# EAGLE board Claritone_Main (EAGLE 9.7.0), part 1 of 2
PCB_MANUFACTURER: JLCPCB
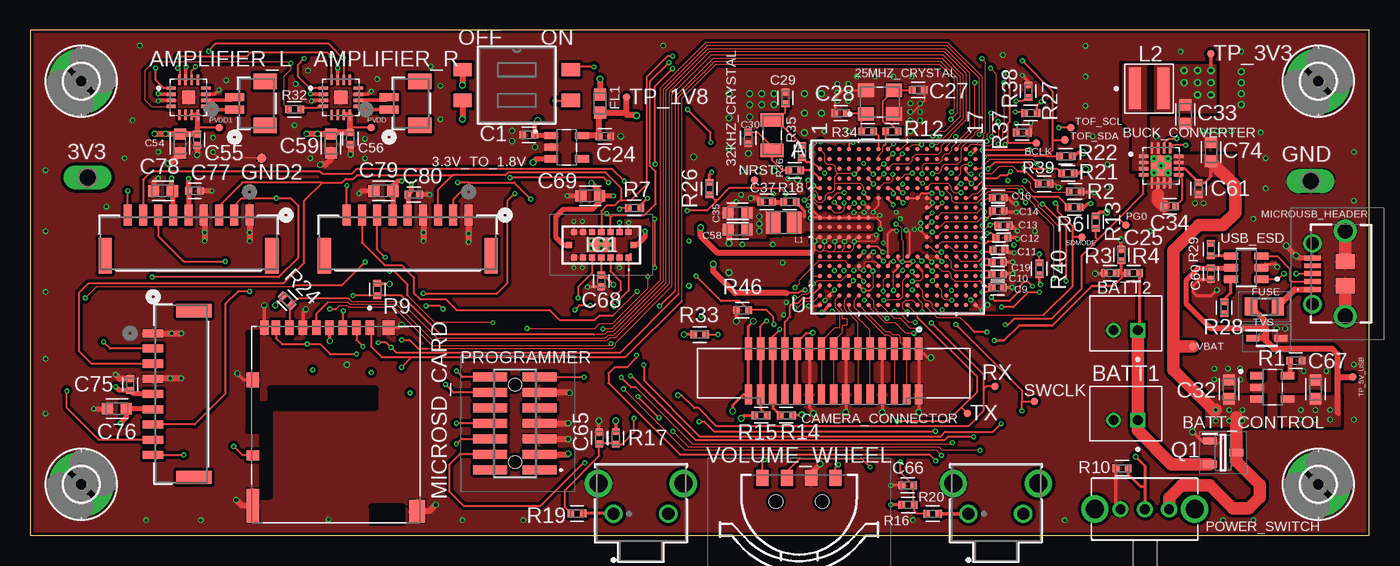
[diagram p5: board, top side]
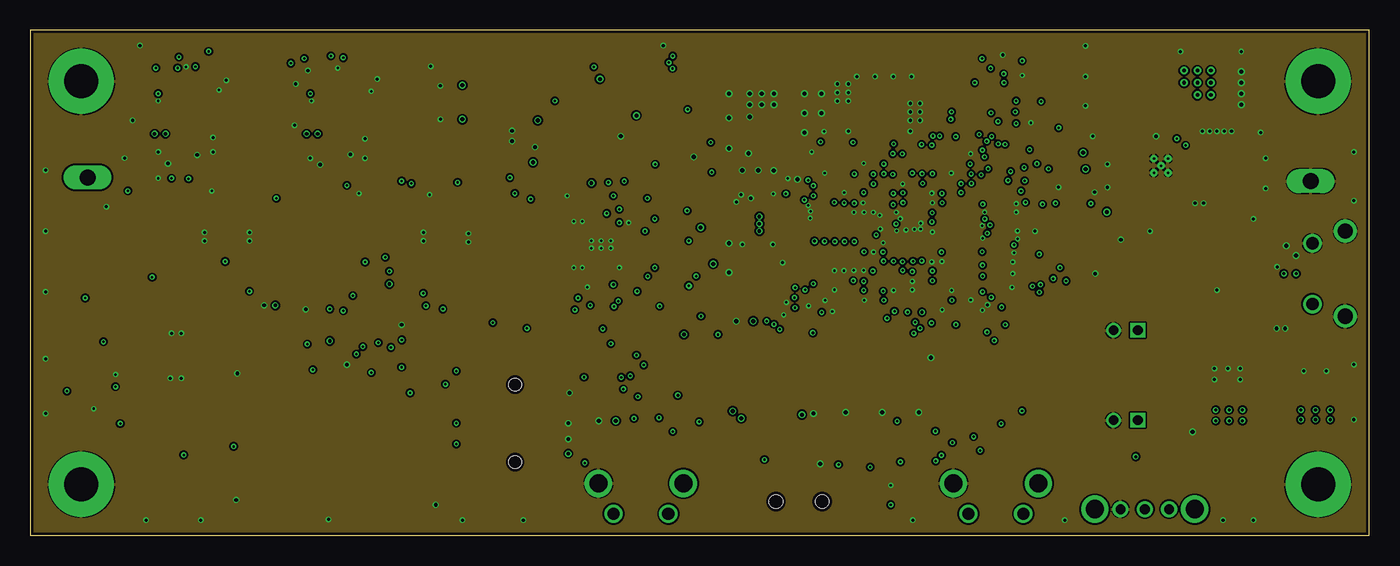
[diagram p6: board, inner layer Route2]
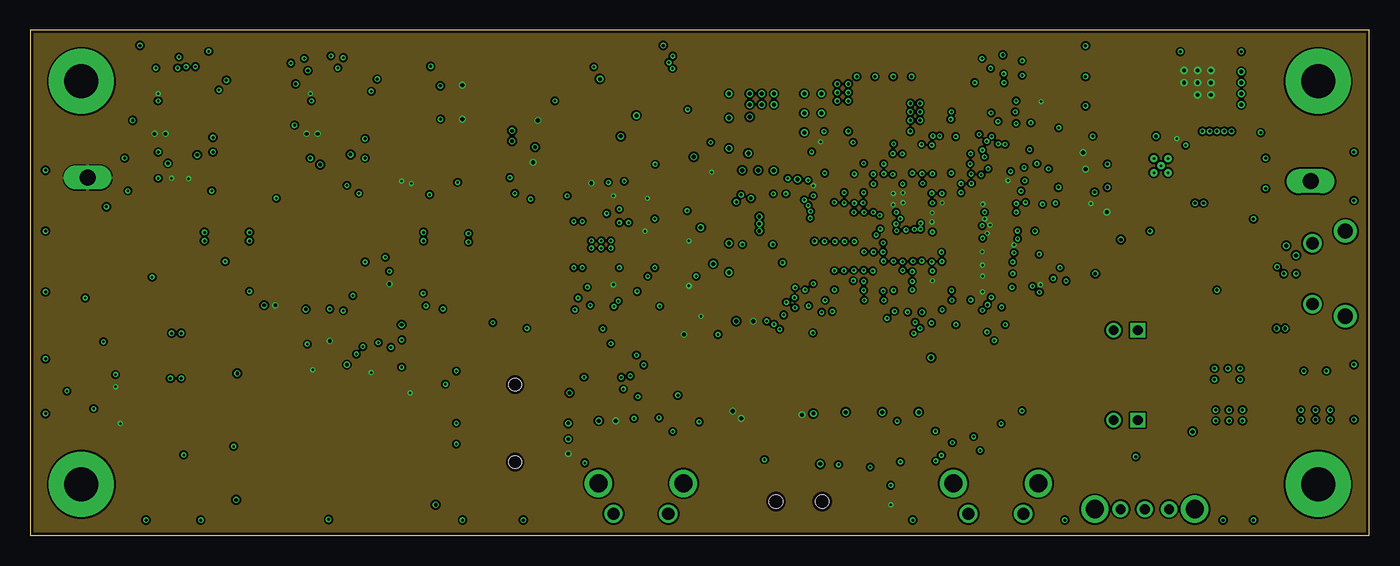
[diagram p7: board, inner layer Route15]
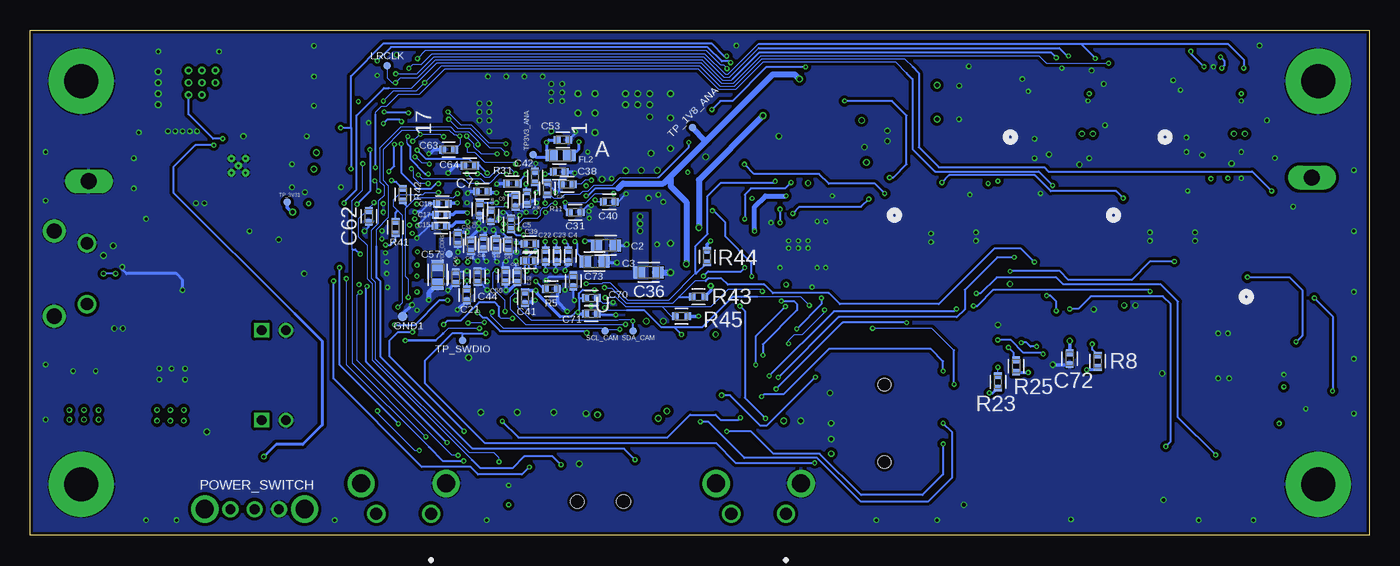
[diagram p8: board, bottom side, seen from below]

Size 110 x 41.5 mm. Coordinates in mm from the lower left corner, seen from the top.
Outline: 0,0 110,0 110,41.5 0,41.5 0,0
Copper layers (1+2*15+16): Top 0.035mm / dielectric 1.5mm / Route2 0.035mm / dielectric 0.15mm / Route15 0.035mm / dielectric 0.2mm / Bottom 0.035mm
Design rules "Fusion Electronics Design Rules *": minimum track width 0.1mm, minimum drill 0.2mm, track to track 6mil, track to pad 0.12mm, pad to pad 0.12mm, via to via 0.12mm, smd to smd 0.12mm, copper to edge 0.24mm, drill to drill 0.2mm, minimum pad ring 0.2mm, minimum via ring 0.1mm, stop-mask expansion 0.019mm, vias tented up to drill 1mm, thermal gap 0.1mm

## Footprints (pad centres in the part's own frame; a part is rotated, then mirrored left to right if it is on the bottom)
SOT95P280X145-5N(3) = smd 1.21 x 0.59: 1 -1.255,0.95; 2 -1.255,0; 3 -1.255,-0.95; 4 1.255,-0.95; 5 1.255,0.95
P1-13Y = drill 1.321 pad 1.905 long: TP 0,0
XTAL_ECS-250-10-33B-CWN-TR = smd 1.3 x 1.1: 1 -1.15,-0.95; 2 1.15,-0.95; 3 1.15,0.95; 4 -1.15,0.95
XTAL_ABS07-32.768KHZ-T = smd 1.1 x 1.9: 1 -1.25,0; 2 1.25,0
QFN50P300X300X80-17N = smd 0.84 x 0.27: 1 -1.435,0.75; 2 -1.435,0.25; 3 -1.435,-0.25; 4 -1.435,-0.75; 9 1.435,-0.75; 10 1.435,-0.25; 11 1.435,0.25; 12 1.435,0.75 | smd 0.27 x 0.84: 5 -0.75,-1.435; 6 -0.25,-1.435; 7 0.25,-1.435; 8 0.75,-1.435; 13 0.75,1.435; 14 0.25,1.435; 15 -0.25,1.435; 16 -0.75,1.435 | smd 1.1 x 1.1: 17 0,0
JST_B2B-PH-K-S = drill 0.8 square: 1 1,-0.55 | drill 0.8: 2 -1,-0.55
SOT95P280X145-5N(1) = smd 1.21 x 0.59: 1 -1.255,0.95; 2 -1.255,0; 3 -1.255,-0.95; 4 1.255,-0.95; 5 1.255,0.95
TP06R = smd 0.6 x 0.6: TP 0,0
CONN_BM09B-GHS-TBT_JST = smd 0.66 x 1.702: 1 5,2.321; 2 3.75,2.321; 3 2.5,2.321; 4 1.25,2.321; 5 0,2.321; 6 -1.25,2.321; 7 -2.5,2.321; 8 -3.75,2.321; 9 -5,2.321 | smd 1.092 x 2.896: 10 -6.85,-1.029; 11 6.85,-1.029
QFN50P300X300X100-17N = smd 0.86 x 0.26: 1 -1.435,0.75; 2 -1.435,0.25; 3 -1.435,-0.25; 4 -1.435,-0.75; 9 1.435,-0.75; 10 1.435,-0.25; 11 1.435,0.25; 12 1.435,0.75 | smd 0.26 x 0.86: 5 -0.75,-1.435; 6 -0.25,-1.435; 7 0.25,-1.435; 8 0.75,-1.435; 13 0.75,1.435; 14 0.25,1.435; 15 -0.25,1.435; 16 -0.75,1.435 | smd 1.68 x 1.68: 17 0,0 | drill 0.2 pad 0.4: 18 0,0; 19 -0.58,0.58; 20 0.58,0.58; 21 -0.58,-0.58; 22 0.58,-0.58
CAPC1005X60 = smd 0.56 x 0.629: 1 -0.485,0; 2 0.485,0
CAPC1608X85 = smd 0.921 x 0.97: 1 -0.775,0; 2 0.775,0
TE_1-1734248-5 = smd 0.6 x 1.85: 1 -7,-2.025; 2 -6,-2.025; 3 -5,-2.025; 4 -4,-2.025; 5 -3,-2.025; 6 -2,-2.025; 7 -1,-2.025; 8 0,-2.025; 9 1,-2.025; 10 2,-2.025; 11 3,-2.025; 12 4,-2.025; 13 5,-2.025; 14 6,-2.025; 15 7,-2.025 | smd 0.6 x 1.65: 1_1 -7,1.725; 2_1 -6,1.725; 3_1 -5,1.725; 4_1 -4,1.725; 5_1 -3,1.725; 6_1 -2,1.725; 7_1 -1,1.725; 8_1 0,1.725; 9_1 1,1.725; 10_1 2,1.725; 11_1 3,1.725; 12_1 4,1.725; 13_1 5,1.725; 14_1 6,1.725; 15_1 7,1.725
BEADC1608X95N = smd 1 x 0.97: 1 -0.735,0; 2 0.735,0
MFPSMF075X2 = smd 1 x 1.5: 1 -1.1,0; 2 1.1,0
TP08R = smd 0.8 x 0.8: TP 0,0
2,8-PAD = drill 2.8 pad 5.334: B2,8 0,0
VL53L7CXV0GC1 = smd 0.5 x 0.5: A1 2.25,-1.05; A2 1.5,-1.05; A3 0.75,-1.05; A4 0,-1.05; A5 -0.75,-1.05; A6 -1.5,-1.05; A7 -2.25,-1.05; B1 2.65,0; B7 -2.65,0; C1 2.25,1.05; C2 1.5,1.05; C3 0.75,1.05; C4 0,1.05; C5 -0.75,1.05; C6 -1.5,1.05; C7 -2.25,1.05 | smd 0.2 x 0.1: A8 2.4,-0.75 | smd 2.316 x 1.2: B4 0,0
INDC2016X120N = smd 1.2 x 1.82: 1 -0.86,0; 2 0.86,0
IND_XFL4020-222MEC = smd 0.98 x 3.4: 1 -1.185,0; 2 1.185,0
HRS_DM3AT-SF-PEJM5 = smd 0.7 x 1.2: 1 2.775,7.975; 2 1.675,7.975; 3 0.575,7.975; 4 -0.525,7.975; 5 -1.625,7.975; 6 -2.725,7.975; 7 -3.825,7.975; 8 -4.925,7.975; SWB -5.875,7.975 | smd 1 x 1.2: P1 -6.825,3.675; P4 4.325,7.975 | smd 1 x 2.8: P2 -6.825,-6.675 | smd 1.3 x 1.9: P3 6.675,-7.125 | smd 1 x 0.8: SWA -6.825,-2.525
101181940001LF = smd 0.4 x 1.35: 1 -1.3,2.35; 2 -0.65,2.35; 3 0,2.35; 4 0.65,2.35; 5 1.3,2.35 | drill 1.01 pad 1.515: MH1 -2.5,2.35; MH4 2.5,2.35 | drill 1.25 pad 1.875: MH2 -3.5,-0.35; MH3 3.5,-0.35 | smd 1.25 x 1.55: MP1 -1,-0.35; MP2 1,-0.35
SWITCH_11MA1QN1 = drill 0.813 pad 1.321: 1 0,0; 2 2.007,0; 3 3.988,0 | drill 1.499 pad 2.007: B1 -2.108,0; B2 6.096,0
FTSH-107-XX-YYY-DV-K-A = smd 0.74 x 2.79: 1 -3.81,-2.035; 2 -3.81,2.035; 3 -2.54,-2.035; 4 -2.54,2.035; 5 -1.27,-2.035; 6 -1.27,2.035; 7 0,-2.035; 8 0,2.035; 9 1.27,-2.035; 10 1.27,2.035; 11 2.54,-2.035; 12 2.54,2.035; 13 3.81,-2.035; 14 3.81,2.035 | hole 1.02: -3.175,0; 3.175,0
SW_B3F-3120_OMR = drill 0.991 pad 1.499: 1 0,0; 2 4.496,0 | drill 1.499 pad 2.007: 3 -1.245,2.489; 4 5.74,2.489
SOT96P240X115-3N = smd 1.15 x 0.6: 1 -1.1,0.96; 2 -1.1,-0.96; 3 1.1,0
RESC1005X40 = smd 0.535 x 0.644: 1 -0.507,0; 2 0.507,0
CONN_BM02B-SRSS-TB_JST = smd 0.66 x 1.549: 1 -0.5,1.83; 2 0.5,1.83 | smd 1.295 x 1.905: 3 -1.8,-0.695; 4 1.8,-0.695
SW_A6S-2102-H_OMR = smd 1.5 x 1.1: 1 -4.45,1.27; 2 -4.45,-1.27; 3 4.45,-1.27; 4 4.45,1.27
SOD2513X110N = smd 1.05 x 0.55: 1 -1.15,0; 2 1.15,0
VFBGA264_14X14_STM = smd 0.356 x 0.356: A1 -6.4,6.4; A2 -5.6,6.4; A3 -4.8,6.4; A4 -4,6.4; A5 -3.2,6.4; A6 -2.4,6.4; A7 -1.6,6.4; A8 -0.8,6.4; A9 0,6.4; A10 0.8,6.4; A11 1.6,6.4; A12 2.4,6.4; A13 3.2,6.4; A14 4,6.4; A15 4.8,6.4; A16 5.6,6.4; A17 6.4,6.4; B1 -6.4,5.6; B2 -5.6,5.6; B3 -4.8,5.6; B4 -4,5.6; B5 -3.2,5.6; B6 -2.4,5.6; B7 -1.6,5.6; B8 -0.8,5.6; B9 0,5.6; B10 0.8,5.6; B11 1.6,5.6; B12 2.4,5.6; B13 3.2,5.6; B14 4,5.6; B15 4.8,5.6; B16 5.6,5.6; B17 6.4,5.6; C1 -6.4,4.8; C2 -5.6,4.8; C3 -4.8,4.8; C4 -4,4.8; C5 -3.2,4.8; C6 -2.4,4.8; C7 -1.6,4.8; C8 -0.8,4.8; C9 0,4.8; C10 0.8,4.8; C11 1.6,4.8; C12 2.4,4.8; C13 3.2,4.8; C14 4,4.8; C15 4.8,4.8; C16 5.6,4.8; C17 6.4,4.8; D1 -6.4,4; D2 -5.6,4; D3 -4.8,4; D4 -4,4; D5 -3.2,4; D6 -2.4,4; D7 -1.6,4; D8 -0.8,4; D9 0,4; D10 0.8,4; D11 1.6,4; D12 2.4,4; D13 3.2,4; D14 4,4; D15 4.8,4; D16 5.6,4; D17 6.4,4; E1 -6.4,3.2; E2 -5.6,3.2; E3 -4.8,3.2; E4 -4,3.2; E5 -3.2,3.2; E6 -2.4,3.2; E7 -1.6,3.2; E8 -0.8,3.2; E9 0,3.2; E10 0.8,3.2; E11 1.6,3.2; E12 2.4,3.2; E13 3.2,3.2; E14 4,3.2; E15 4.8,3.2; E16 5.6,3.2; E17 6.4,3.2; F1 -6.4,2.4; F2 -5.6,2.4; F3 -4.8,2.4; F4 -4,2.4; F5 -3.2,2.4; F6 -2.4,2.4; F7 -1.6,2.4; F8 -0.8,2.4; F9 0,2.4; F10 0.8,2.4; F11 1.6,2.4; F12 2.4,2.4; F13 3.2,2.4; F14 4,2.4; F15 4.8,2.4; F16 5.6,2.4; F17 6.4,2.4; G1 -6.4,1.6; G2 -5.6,1.6; G3 -4.8,1.6; G4 -4,1.6; G5 -3.2,1.6; G6 -2.4,1.6; G12 2.4,1.6; G13 3.2,1.6; G14 4,1.6; G15 4.8,1.6; G16 5.6,1.6; G17 6.4,1.6; H1 -6.4,0.8; H2 -5.6,0.8; H3 -4.8,0.8; H4 -4,0.8; H5 -3.2,0.8; H6 -2.4,0.8; H12 2.4,0.8; H13 3.2,0.8; H14 4,0.8; H15 4.8,0.8; H16 5.6,0.8; H17 6.4,0.8; J1 -6.4,0; J2 -5.6,0; J3 -4.8,0; J4 -4,0; J5 -3.2,0; J6 -2.4,0; J12 2.4,0; J13 3.2,0; J14 4,0; J15 4.8,0; J16 5.6,0; J17 6.4,0; K1 -6.4,-0.8; K2 -5.6,-0.8; K3 -4.8,-0.8; K4 -4,-0.8; K5 -3.2,-0.8; K6 -2.4,-0.8; K12 2.4,-0.8; K13 3.2,-0.8; K14 4,-0.8; K15 4.8,-0.8; K16 5.6,-0.8; K17 6.4,-0.8; L1 -6.4,-1.6; L2 -5.6,-1.6; L3 -4.8,-1.6; L4 -4,-1.6; L5 -3.2,-1.6; L6 -2.4,-1.6; L12 2.4,-1.6; L13 3.2,-1.6; L14 4,-1.6; L15 4.8,-1.6; L16 5.6,-1.6; L17 6.4,-1.6; M1 -6.4,-2.4; M2 -5.6,-2.4; M3 -4.8,-2.4; M4 -4,-2.4; M5 -3.2,-2.4; M6 -2.4,-2.4; M7 -1.6,-2.4; M8 -0.8,-2.4; M9 0,-2.4; M10 0.8,-2.4; M11 1.6,-2.4; M12 2.4,-2.4; M13 3.2,-2.4; M14 4,-2.4; M15 4.8,-2.4; M16 5.6,-2.4; M17 6.4,-2.4; N1 -6.4,-3.2; N2 -5.6,-3.2; N3 -4.8,-3.2; N4 -4,-3.2; N5 -3.2,-3.2; N6 -2.4,-3.2; N7 -1.6,-3.2; N8 -0.8,-3.2; N9 0,-3.2; N10 0.8,-3.2; N11 1.6,-3.2; N12 2.4,-3.2; N13 3.2,-3.2; N14 4,-3.2; N15 4.8,-3.2; N16 5.6,-3.2; N17 6.4,-3.2; P1 -6.4,-4; P2 -5.6,-4; P3 -4.8,-4; P4 -4,-4; P5 -3.2,-4; P6 -2.4,-4; P7 -1.6,-4; P8 -0.8,-4; P9 0,-4; P10 0.8,-4; P11 1.6,-4; P12 2.4,-4; P13 3.2,-4; P14 4,-4; P15 4.8,-4; P16 5.6,-4; P17 6.4,-4; R1 -6.4,-4.8; R2 -5.6,-4.8; R3 -4.8,-4.8; R4 -4,-4.8; R5 -3.2,-4.8; R6 -2.4,-4.8; R7 -1.6,-4.8; R8 -0.8,-4.8; R9 0,-4.8; R10 0.8,-4.8; R11 1.6,-4.8; R12 2.4,-4.8; R13 3.2,-4.8; R14 4,-4.8; R15 4.8,-4.8; R16 5.6,-4.8; R17 6.4,-4.8; T1 -6.4,-5.6; T2 -5.6,-5.6; T3 -4.8,-5.6; T4 -4,-5.6; T5 -3.2,-5.6; T6 -2.4,-5.6; T7 -1.6,-5.6; T8 -0.8,-5.6; T9 0,-5.6; T10 0.8,-5.6; T11 1.6,-5.6; T12 2.4,-5.6; T13 3.2,-5.6; T14 4,-5.6; T15 4.8,-5.6; T16 5.6,-5.6; T17 6.4,-5.6; U1 -6.4,-6.4; U2 -5.6,-6.4; U3 -4.8,-6.4; U4 -4,-6.4; U5 -3.2,-6.4; U6 -2.4,-6.4; U7 -1.6,-6.4; U8 -0.8,-6.4; U9 0,-6.4; U10 0.8,-6.4; U11 1.6,-6.4; U12 2.4,-6.4; U13 3.2,-6.4; U14 4,-6.4; U15 4.8,-6.4; U16 5.6,-6.4; U17 6.4,-6.4
SOT95P280X145-6N = smd 1.21 x 0.59: 1 -1.255,0.95; 2 -1.255,0; 3 -1.255,-0.95; 4 1.255,-0.95; 5 1.255,0; 6 1.255,0.95
SLLB510100 = smd 1 x 1.3: 1 -3,-4.125; 2 3,-4.125; C1 -1,-4.125; T1 1,-4.125 | hole 1.1: -1.9,-2.175; 1.9,-2.175

## Placement (x,y rotation side)
3.3V_TO_1.8V  TPS7A2018PDBVR  [SOT95P280X145-5N(3)]  44.07,31.89 0 top
3V3  TPPAD1-13Y  [P1-13Y]  4.7,29.4 90 top
25MHZ_CRYSTAL  ECS-250-10-33B-CWN-TR  [XTAL_ECS-250-10-33B-CWN-TR]  69.8,35.6 0 top
32KHZ_CRYSTAL  ABS07-32.768KHZ-T  [XTAL_ABS07-32.768KHZ-T]  60.95,32.89 90 top
AMPLIFIER_L  MAX98357AETE+T  [QFN50P300X300X80-17N]  13,36 0 top
AMPLIFIER_R  MAX98357AETE+T  [QFN50P300X300X80-17N]  25.5,36 0 top
BATT1  B2B-PH-K-S  [JST_B2B-PH-K-S]  90,10 0 top
BATT2  B2B-PH-K-S  [JST_B2B-PH-K-S]  90,17.4 0 top
BATT_CONTROL  MCP73831T-2ACI/OT  [SOT95P280X145-5N(1)]  102.05,12.16 0 top
BCLK  TPTP06R  [TP06R]  82.67,32.23 0 top
BREAKOUT_TOF_1  JST_GH_1X09_BM09B-GHS-TBT  [CONN_BM09B-GHS-TBT_JST]  31,24 0 top
BREAKOUT_TOF_2  JST_GH_1X09_BM09B-GHS-TBT  [CONN_BM09B-GHS-TBT_JST]  13,24 0 top
BREAKOUT_TOF_3  JST_GH_1X09_BM09B-GHS-TBT  [CONN_BM09B-GHS-TBT_JST]  12.4,11.6 90 top
BUCK_CONVERTER  TPS62132RGTR  [QFN50P300X300X100-17N]  92.9,30.38 0 top
C1  2.2uF  [CAPC1005X60]  40.94,32.9 180 top
C2  10uF  [CAPC1608X85]  62.72,23.82 0 bottom
C3  10uF  [CAPC1608X85]  63.64,22.5 0 bottom
C4  1uF  [CAPC1005X60]  65.8,22.95 270 bottom
C5  0.1uF  [CAPC1005X60]  70.51,25.6 90 bottom
C6  0.1uF  [CAPC1005X60]  73.08,26.78 270 bottom
C7  0.1uF  [CAPC1005X60]  72.88,28.26 180 bottom
C8  0.1uF  [CAPC1005X60]  70.13,27.46 270 bottom
C9  0.1uF  [CAPC1005X60]  79.49,20.36 0 top
C10  0.1uF  [CAPC1005X60]  79.49,21.46 0 top
C11  0.1uF  [CAPC1005X60]  79.58,23.46 0 top
C12  0.1uF  [CAPC1005X60]  79.83,24.46 0 top
C13  0.1uF  [CAPC1005X60]  79.98,25.46 0 top
C14  0.1uF  [CAPC1005X60]  79.53,26.66 0 top
C15  0.1uF  [CAPC1005X60]  76.28,25.43 180 bottom
C16  0.1uF  [CAPC1005X60]  79.53,27.73 0 top
C17  0.1uF  [CAPC1005X60]  76.24,26.35 180 bottom
C18  0.1uF  [CAPC1005X60]  76.14,27.25 180 bottom
C19  0.1uF  [CAPC1005X60]  79.49,22.45 0 top
C20  0.1uF  [CAPC1005X60]  72.17,26.25 270 bottom
C21  0.1uF  [CAPC1005X60]  74.13,19.75 270 bottom
C22  0.1uF  [CAPC1005X60]  67.66,22.95 270 bottom
C23  1uF  [CAPC1005X60]  66.75,22.95 270 bottom
C24  2.2uF  [CAPC1005X60]  47.2,32.8 180 top
C25  0.1uF  [CAPC1005X60]  89.65,23.04 90 top
C26  4.7uF  [CAPC1005X60]  65.89,28.85 0 bottom
C27  12pF  [CAPC1005X60]  72.96,36.6 0 top
C28  12pF  [CAPC1005X60]  66.58,34.7 0 top
C29  18 pF  [CAPC1005X60]  62.04,35.95 90 top
C30  18 pF  [CAPC1005X60]  58.99,32.65 90 top
C31  10nF  [CAPC1005X60]  65.24,26.55 180 bottom
C32  10uF  [CAPC1608X85]  98.5,12 270 top
C33  22uF  [CAPC1608X85]  94.9,34.6 90 top
C34  3.3nF  [CAPC1005X60]  93.61,27.05 0 top
C35  22 uF  [CAPC1608X85]  58.1,26.5 0 top
C36  22 uF  [CAPC1608X85]  59.2,21.6 180 bottom
C37  2.2nF  [CAPC1005X60]  60.5,27.4 0 top
C38  0.1uF  [CAPC1005X60]  66.55,29.86 0 bottom
C39  0.1uF  [CAPC1005X60]  68.95,23.96 180 bottom
C40  0.1uF  [CAPC1005X60]  62.44,27.4 0 bottom
C41  0.1uF  [CAPC1005X60]  69.35,19.52 270 bottom
C42  0.1uF  [CAPC1005X60]  68.54,29.45 90 bottom
C43  0.1uF  [CAPC1005X60]  68.99,22.55 0 bottom
C44  1uF  [CAPC1005X60]  73.26,21.25 270 bottom
C45  1uF  [CAPC1005X60]  75.04,21.18 270 bottom
C46  1uF  [CAPC1005X60]  72.79,24 90 bottom
C47  1uF  [CAPC1005X60]  70.74,23.8 90 bottom
C48  1uF  [CAPC1005X60]  73.79,23.8 90 bottom
C49  1uF  [CAPC1005X60]  71.74,23.9 90 bottom
C50  1uF  [CAPC1005X60]  70.96,21.31 270 bottom
C51  1uF  [CAPC1005X60]  74.88,24.4 90 bottom
C52  1uF  [CAPC1005X60]  69.99,21.25 270 bottom
C53  1 uF  [CAPC1005X60]  66.24,32.5 0 bottom
C54  10uF  [CAPC1608X85]  12.3,32.2 270 top
C55  0.1uF  [CAPC1005X60]  13.7,32.5 270 top
C56  0.1uF  [CAPC1005X60]  26.3,32.6 270 top
C57  22 uF  [CAPC1608X85]  76.54,21.4 90 bottom
C58  22 uF  [CAPC1608X85]  58.11,25.13 0 top
C59  10uF  [CAPC1608X85]  24.7,32.2 270 top
C60  0.1uF  [CAPC1005X60]  97,21.5 270 top
C61  0.1uF  [CAPC1005X60]  96,28.5 90 top
C62  0.047uF  [CAPC1005X60]  82.2,26.21 270 bottom
C63  0.047uF  [CAPC1005X60]  75.64,31.7 180 bottom
C64  0.047uF  [CAPC1005X60]  73.9,30.39 180 bottom
C65  0.1uF  [CAPC1005X60]  46.74,8 270 top
C66  0.1uF  [CAPC1005X60]  72.09,4.1 0 top
C67  10uF  [CAPC1608X85]  105.6,12 270 top
C68  0.1uF  [CAPC1005X60]  46.9,20.9 90 top
C69  4.7uF  [CAPC1608X85]  46,27.9 0 top
C70  0.1uF  [CAPC1005X60]  63.9,19.5 180 bottom
C71  1uF  [CAPC1005X60]  63.9,18.2 0 bottom
C72  1 uF  [CAPC1005X60]  24.6,14.5 90 bottom
C73  1uF  [CAPC1005X60]  65.4,20.9 270 bottom
C74  10 uF  [CAPC1608X85]  97,31.5 270 top
C75  0.1uF  [CAPC1005X60]  8.2,12.4 90 top
C76  4.7uF  [CAPC1608X85]  7.1,10.4 180 top
C77  0.1uF  [CAPC1005X60]  13.5,28.3 0 top
C78  4.7uF  [CAPC1608X85]  10.9,28.3 180 top
C79  4.7uF  [CAPC1608X85]  29,28.3 180 top
C80  0.1uF  [CAPC1005X60]  31.5,28 0 top
CAMERA_CONNECTOR  1-1734248-5  [TE_1-1734248-5]  66,13.29 180 top
FL1  BLM18AG121SN1D  [BEADC1608X95N]  46.8,35.48 270 top
FL2  BLM18AG121SN1D  [BEADC1608X95N]  66.45,31.23 0 bottom
FUSE  MF-PSMF075X-2  [MFPSMF075X2]  101.4,18.8 0 top
GND  TPPAD1-13Y  [P1-13Y]  105.2,29.1 90 top
GND1  TPTP08R  [TP08R]  79.4,18 180 bottom
GND2  TPTP08R  [TP08R]  19,31 0 top
H5  MOUNT-PAD-ROUND2.8  [2,8-PAD]  4.18,4.18 0 top
H6  MOUNT-PAD-ROUND2.8  [2,8-PAD]  4.18,37.32 0 top
H7  MOUNT-PAD-ROUND2.8  [2,8-PAD]  105.82,37.32 0 top
H8  MOUNT-PAD-ROUND2.8  [2,8-PAD]  105.82,4.18 0 top
IC1  VL53L7CXV0GC_1  [VL53L7CXV0GC1]  46.91,23.87 0 top
L1  DFE201612E-1R0M=P2  [INDC2016X120N]  61.9,25.7 0 top
L2  XFL4020-222MEC  [IND_XFL4020-222MEC]  91.92,36.72 0 top
LRCLK  TPTP06R  [TP06R]  80.7,38.6 180 bottom
MICROSD_CARD  DM3AT-SF-PEJM5  [HRS_DM3AT-SF-PEJM5]  25.11,9.09 0 top
MICROUSB_HEADER  10118194-0001LF  [101181940001LF]  107.7,21.5 90 top
NRST  TPTP06R  [TP06R]  59.5,29.2 0 top
PG0  TPTP06R  [TP06R]  90,25.5 0 top
POWER_SWITCH  OS102011MA1QN1  [SWITCH_11MA1QN1]  89.58,2.14 0 top
PROGRAMMER  FTSH-107-01-L-DV-K-A  [FTSH-107-XX-YYY-DV-K-A]  39.82,9.19 90 top
PUSHBUTTON1  B3F-3120  [SW_B3F-3120_OMR]  77.09,1.77 0 top
PUSHBUTTON2  B3F-3120  [SW_B3F-3120_OMR]  47.92,1.77 0 top
PVDD  TPTP06R  [TP06R]  28,33.5 0 top
PVDD1  TPTP06R  [TP06R]  15.5,33.5 0 top
Q1  DMG2301L-7  [SOT96P240X115-3N]  98,6.8 0 top
R1  2k  [RESC1005X40]  103.98,14.35 180 top
R2  47k  [RESC1005X40]  85.84,28.25 180 top
R3  10k  [RESC1005X40]  88.72,21.55 0 top
R4  15k  [RESC1005X40]  90.64,21.55 180 top
R5  200  [RESC1005X40]  67.2,20.25 180 bottom
R6  47k  [RESC1005X40]  85.76,26.95 0 top
R7  47k  [RESC1005X40]  49.63,26.9 180 top
R8  22k  [RESC1005X40]  22.3,14.3 90 bottom
R9  22k  [RESC1005X40]  28.5,20.2 270 top
R10  100k  [RESC1005X40]  89.7,5.5 0 top
R11  10k  [RESC1005X40]  67.54,28.5 90 bottom
R12  0  [RESC1005X40]  70.8,33.2 0 top
R13  100k  [RESC1005X40]  87.54,25.75 90 top
R14  2.2k  [RESC1005X40]  62.12,9.85 0 top
R15  2.2k  [RESC1005X40]  60.04,9.85 180 top
R16  10k  [RESC1005X40]  72.11,2.49 180 top
R17  10k  [RESC1005X40]  48.1,7.99 90 top
R18  2  [RESC1005X40]  62.4,27.4 0 top
R19  100  [RESC1005X40]  44.92,1.79 0 top
R20  100  [RESC1005X40]  74.14,1.76 0 top
R21  2.2k  [RESC1005X40]  85.26,29.75 180 top
R22  2.2k  [RESC1005X40]  85.08,31.15 180 top
R23  22k  [RESC1005X40]  30.5,12.6 90 bottom
R24  22k  [RESC1005X40]  21.1,19.3 315 top
R25  22k  [RESC1005X40]  29,13.9 90 bottom
R26  10k  [RESC1005X40]  55.8,28.5 90 top
R27  47k  [RESC1005X40]  82.2,34.7 180 top
R28  22  [RESC1005X40]  98.1,18.7 270 top
R29  22  [RESC1005X40]  97,23.49 90 top
R30  200  [RESC1005X40]  69.18,27.71 90 bottom
R31  200  [RESC1005X40]  70.4,28.9 0 bottom
R32  220k  [RESC1005X40]  21.7,35 0 top
R33  10k  [RESC1005X40]  55,16.5 0 top
R34  0  [RESC1005X40]  68.8,33.2 180 top
R35  0  [RESC1005X40]  63.4,31.55 90 top
R36  0  [RESC1005X40]  62.8,30 180 top
R37  47k  [RESC1005X40]  81.5,33.1 180 top
R38  47k  [RESC1005X40]  82,36.5 270 top
R39  47k  [RESC1005X40]  83.3,28.9 180 top
R40  47k  [RESC1005X40]  82.9,21.9 90 top
R41  47k  [RESC1005X40]  80,25.3 90 bottom
R42  47k  [RESC1005X40]  79.4,28 270 bottom
R43  47k  [RESC1005X40]  55.1,19.6 180 bottom
R44  47k  [RESC1005X40]  54.4,22.9 270 bottom
R45  47k  [RESC1005X40]  56.5,18 180 bottom
R46  10k  [RESC1005X40]  58.5,18.5 0 top
RX  TPTP06R  [TP06R]  79.27,12.23 0 top
SCL_CAM  TPTP06R  [TP06R]  62.8,16.8 180 bottom
SDA_CAM  TPTP06R  [TP06R]  60.5,16.8 180 bottom
SDMODE  TPTP06R  [TP06R]  86.4,24.5 0 top
SPEAKER_L  BM02B-SRSS-TB_(LF)(SN)  [CONN_BM02B-SRSS-TB_JST]  18.6,35.5 90 top
SPEAKER_R  BM02B-SRSS-TB_(LF)(SN)  [CONN_BM02B-SRSS-TB_JST]  31.3,35.5 90 top
SW1  A6S-2102-H  [SW_A6S-2102-H_OMR]  39.96,37 0 top
SWCLK  TPTP06R  [TP06R]  82.5,11 0 top
TOF_SCL  TPTP06R  [TP06R]  85.5,33.5 0 top
TOF_SDA  TPTP06R  [TP06R]  85,32.5 0 top
TP3V3_ANA  TPTP06R  [TP06R]  68.7,31.3 180 bottom
TP_1V8  TPTP06R  [TP06R]  49,36 0 top
TP_1V8_ANA  TPTP06R  [TP06R]  55.6,33.5 180 bottom
TP_3V3  TPTP06R  [TP06R]  97,39.58 0 top
TP_3V31  TPTP06R  [TP06R]  88.9,27.4 180 bottom
TP_5V_USB  TPTP06R  [TP06R]  108.65,13 0 top
TP_SWDIO  TPTP06R  [TP06R]  74.5,16 180 bottom
TVS  SD05.TCT  [SOD2513X110N]  101.59,16.2 0 top
TX  TPTP06R  [TP06R]  77,10 0 top
U1  STM32N657X0H3Q  [VFBGA264_14X14_STM]  71.27,25.32 0 top
USB_ESD  USBLC6-2SC6  [SOT95P280X145-6N]  99.9,22 180 top
VBAT  TPTP06R  [TP06R]  95.5,15.5 0 top
VDD_CORE  TPTP06R  [TP06R]  75.6,23.1 180 bottom
VOLUME_WHEEL  SLLB510100  [SLLB510100]  63.16,0.58 180 top